# Altium schematic sheet LightRelayConnector.SchDoc
size A; SheetNumber: 2; SheetTotal: 2
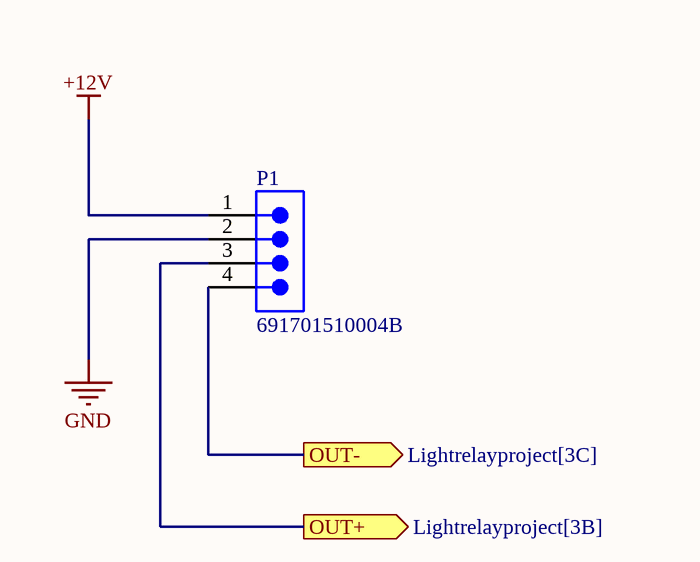
[diagram p0: LightRelayConnector.SchDoc]

## Parts
P1  691701510004B  [691701510004B]

## Ports
OUT+ (out, see Lightrelayproject[3B]), OUT- (out, see Lightrelayproject[3C])

## Nets
+12V: P1.1
GND: P1.2
OUT+: P1.3 ; port OUT+
OUT-: P1.4 ; port OUT-

## Library data of the parts
P1 = CMP-1502-02331-3: Terminal Block, 5.08MM, Close Vertical Pcb Header, Thr Type, 4 Pins; Number of Contacts: 4; Voltage Rating: 300V; Current Rating: 10A; Gender: Male; Contact Material: Brass; Number of Pins: 4; REACH SVHC: Unknown; Lead Pitch: 5.08mm; Connector Type: Terminal Block; Max Operating Temperature: 105°C; Min Operating Temperature: -40°C; Housing Material: Polymer; Contact Plating: Tin; Mount: Through Hole; RoHS: Compliant; Color: Black; Pitch: 5.08mm; Length: 23.12mm; Termination: PCB